# Altium schematic sheet Power_Sense.SchDoc: Power Sense
size A4; SheetNumber: 17; SheetTotal: 18
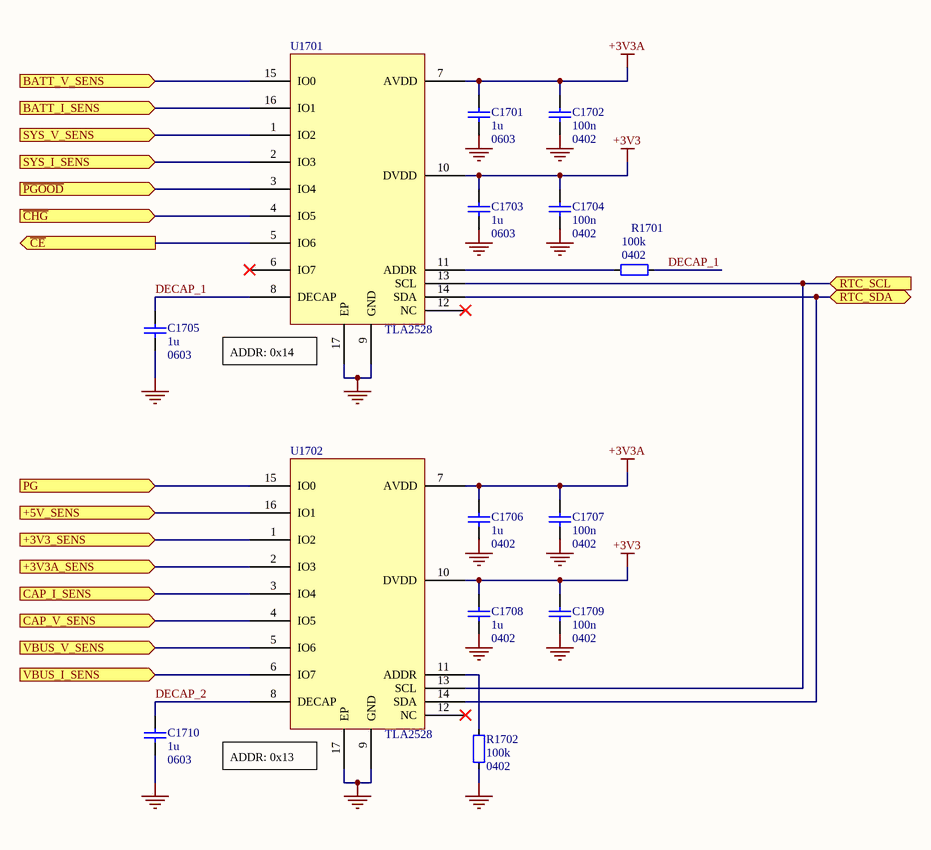
[diagram p0: Power_Sense.SchDoc]

## Parts
C1701  1u  Footprint: 0603  [CAP_0603_B]
C1702  100n  Footprint: 0402  [CAP_0402_B]
C1703  1u  Footprint: 0603  [CAP_0603_B]
C1704  100n  Footprint: 0402  [CAP_0402_B]
C1705  1u  Footprint: 0603  [CAP_0603_B]
C1706  1u  Footprint: 0402  [CAP_0402_B]
C1707  100n  Footprint: 0402  [CAP_0402_B]
C1708  1u  Footprint: 0402  [CAP_0402_B]
C1709  100n  Footprint: 0402  [CAP_0402_B]
C1710  1u  Footprint: 0603  [CAP_0603_B]
R1701  100k  Footprint: 0402  [RES_0402_A]
R1702  100k  Footprint: 0402  [RES_0402_A]
U1701  TLA2528  [TLA2528]
U1702  TLA2528  [TLA2528]

## Ports
+3V3_SENS (in, see Top_Level[3A], 3V3_Regulators[4B]), +3V3A_SENS (in, see Top_Level[3A], 3V3_Regulators[4C]), +5V_SENS (in, see Top_Level[3A], 5V_Regulator[4B]), BATT_I_SENS (in, see Top_Level[3A], Battery_Charging[1A]), BATT_V_SENS (in, see Top_Level[3A], Battery_Charging[1B]), CAP_I_SENS (in, see Top_Level[3B], RTC[3C]), CAP_V_SENS (in, see Top_Level[3B], RTC[3C]), PG (in, see Top_Level[3A], 5V_Regulator[2B]), RTC_SCL (in, see Top_Level[3A], MCU[4C]), RTC_SDA (bidir, see Top_Level[3A], MCU[4C]), SYS_I_SENS (in, see Top_Level[3A], Battery_Charging[4A]), SYS_V_SENS (in, see Top_Level[3A], Battery_Charging[4B]), VBUS_I_SENS (in, see Top_Level[3B], USB[4B]), VBUS_V_SENS (in, see Top_Level[3B], USB[4C]), ~{CE} (out, see Top_Level[3A], Battery_Charging[3C]), ~{CHG} (in, see Top_Level[3A], Battery_Charging[4D]), ~{PGOOD} (in, see Top_Level[3A], Battery_Charging[4D])

## Nets
+3V3: C1703.1 C1704.1 C1708.1 C1709.1 U1701.10(DVDD) U1702.10(DVDD)
+3V3A: C1701.1 C1702.1 C1706.1 C1707.1 U1701.7(AVDD) U1702.7(AVDD)
GND: C1701.2 C1702.2 C1703.2 C1704.2 C1705.2 C1706.2 C1707.2 C1708.2 C1709.2 C1710.2 R1702.2(a) U1701.9(GND) U1701.17(EP) U1702.9(GND) U1702.17(EP)
+3V3_SENS: U1702.1(IO2) ; port +3V3_SENS
+3V3A_SENS: U1702.2(IO3) ; port +3V3A_SENS
+5V_SENS: U1702.16(IO1) ; port +5V_SENS
BATT_I_SENS: U1701.16(IO1) ; port BATT_I_SENS
BATT_V_SENS: U1701.15(IO0) ; port BATT_V_SENS
~{CE}: U1701.5(IO6) ; port ~{CE}
~{CHG}: U1701.4(IO5) ; port ~{CHG}
CAP_I_SENS: U1702.3(IO4) ; port CAP_I_SENS
CAP_V_SENS: U1702.4(IO5) ; port CAP_V_SENS
DECAP_1: C1705.1 R1701.2(a) U1701.8(DECAP)
DECAP_2: C1710.1 U1702.8(DECAP)
~{PGOOD}: U1701.3(IO4) ; port ~{PGOOD}
PG: U1702.15(IO0) ; port PG
RTC_SCL: U1701.13(SCL) U1702.13(SCL) ; port RTC_SCL
RTC_SDA: U1701.14(SDA) U1702.14(SDA) ; port RTC_SDA
SYS_I_SENS: U1701.2(IO3) ; port SYS_I_SENS
SYS_V_SENS: U1701.1(IO2) ; port SYS_V_SENS
VBUS_I_SENS: U1702.6(IO7) ; port VBUS_I_SENS
VBUS_V_SENS: U1702.5(IO6) ; port VBUS_V_SENS
NetR1701_1: R1701.1(a) U1701.11(ADDR)
NetR1702_1: R1702.1(a) U1702.11(ADDR)

Not connected (* = marked no-connect by the designer): U1701 6(IO7)* 12(NC)*; U1702 12(NC)*

## Notes on the sheet
- (near U1701) ADDR: 0x14
- (near U1702) ADDR: 0x13

## Library data of the parts
C1701 C1703 C1705 C1710 = CAP_0603: 0603 SMD Capacitor
C1702 C1704 C1706-C1709 = CAP_0402: 0402 SMD Capacitor
R1701 R1702 = RES_0402: 0402 SMD Resistor
U1701 U1702 = TLA2528: 12 Bit Analog to Digital Converter 8 Input 1 SAR 16-WQFN (3x3); Supplier 1: Mouser; Supplier Part Number 1: 595-TLA2528IRTER